# EasyEDA Pro project verysunshine-34e06a1e8bfa4ca7a126286b764d3f7b-42c390bd.epro

# Schematic 主机板SCH
Create Date: 2022-11-16; Page Name: Sheet_1; Project Name: 星火计划|分布式设备的物联网控制系统设计; Schematic Name: 主机板SCH; Update Date: 2022-11-18; Company: 嘉立创EDA; Page Size: A3; Version: V1.0
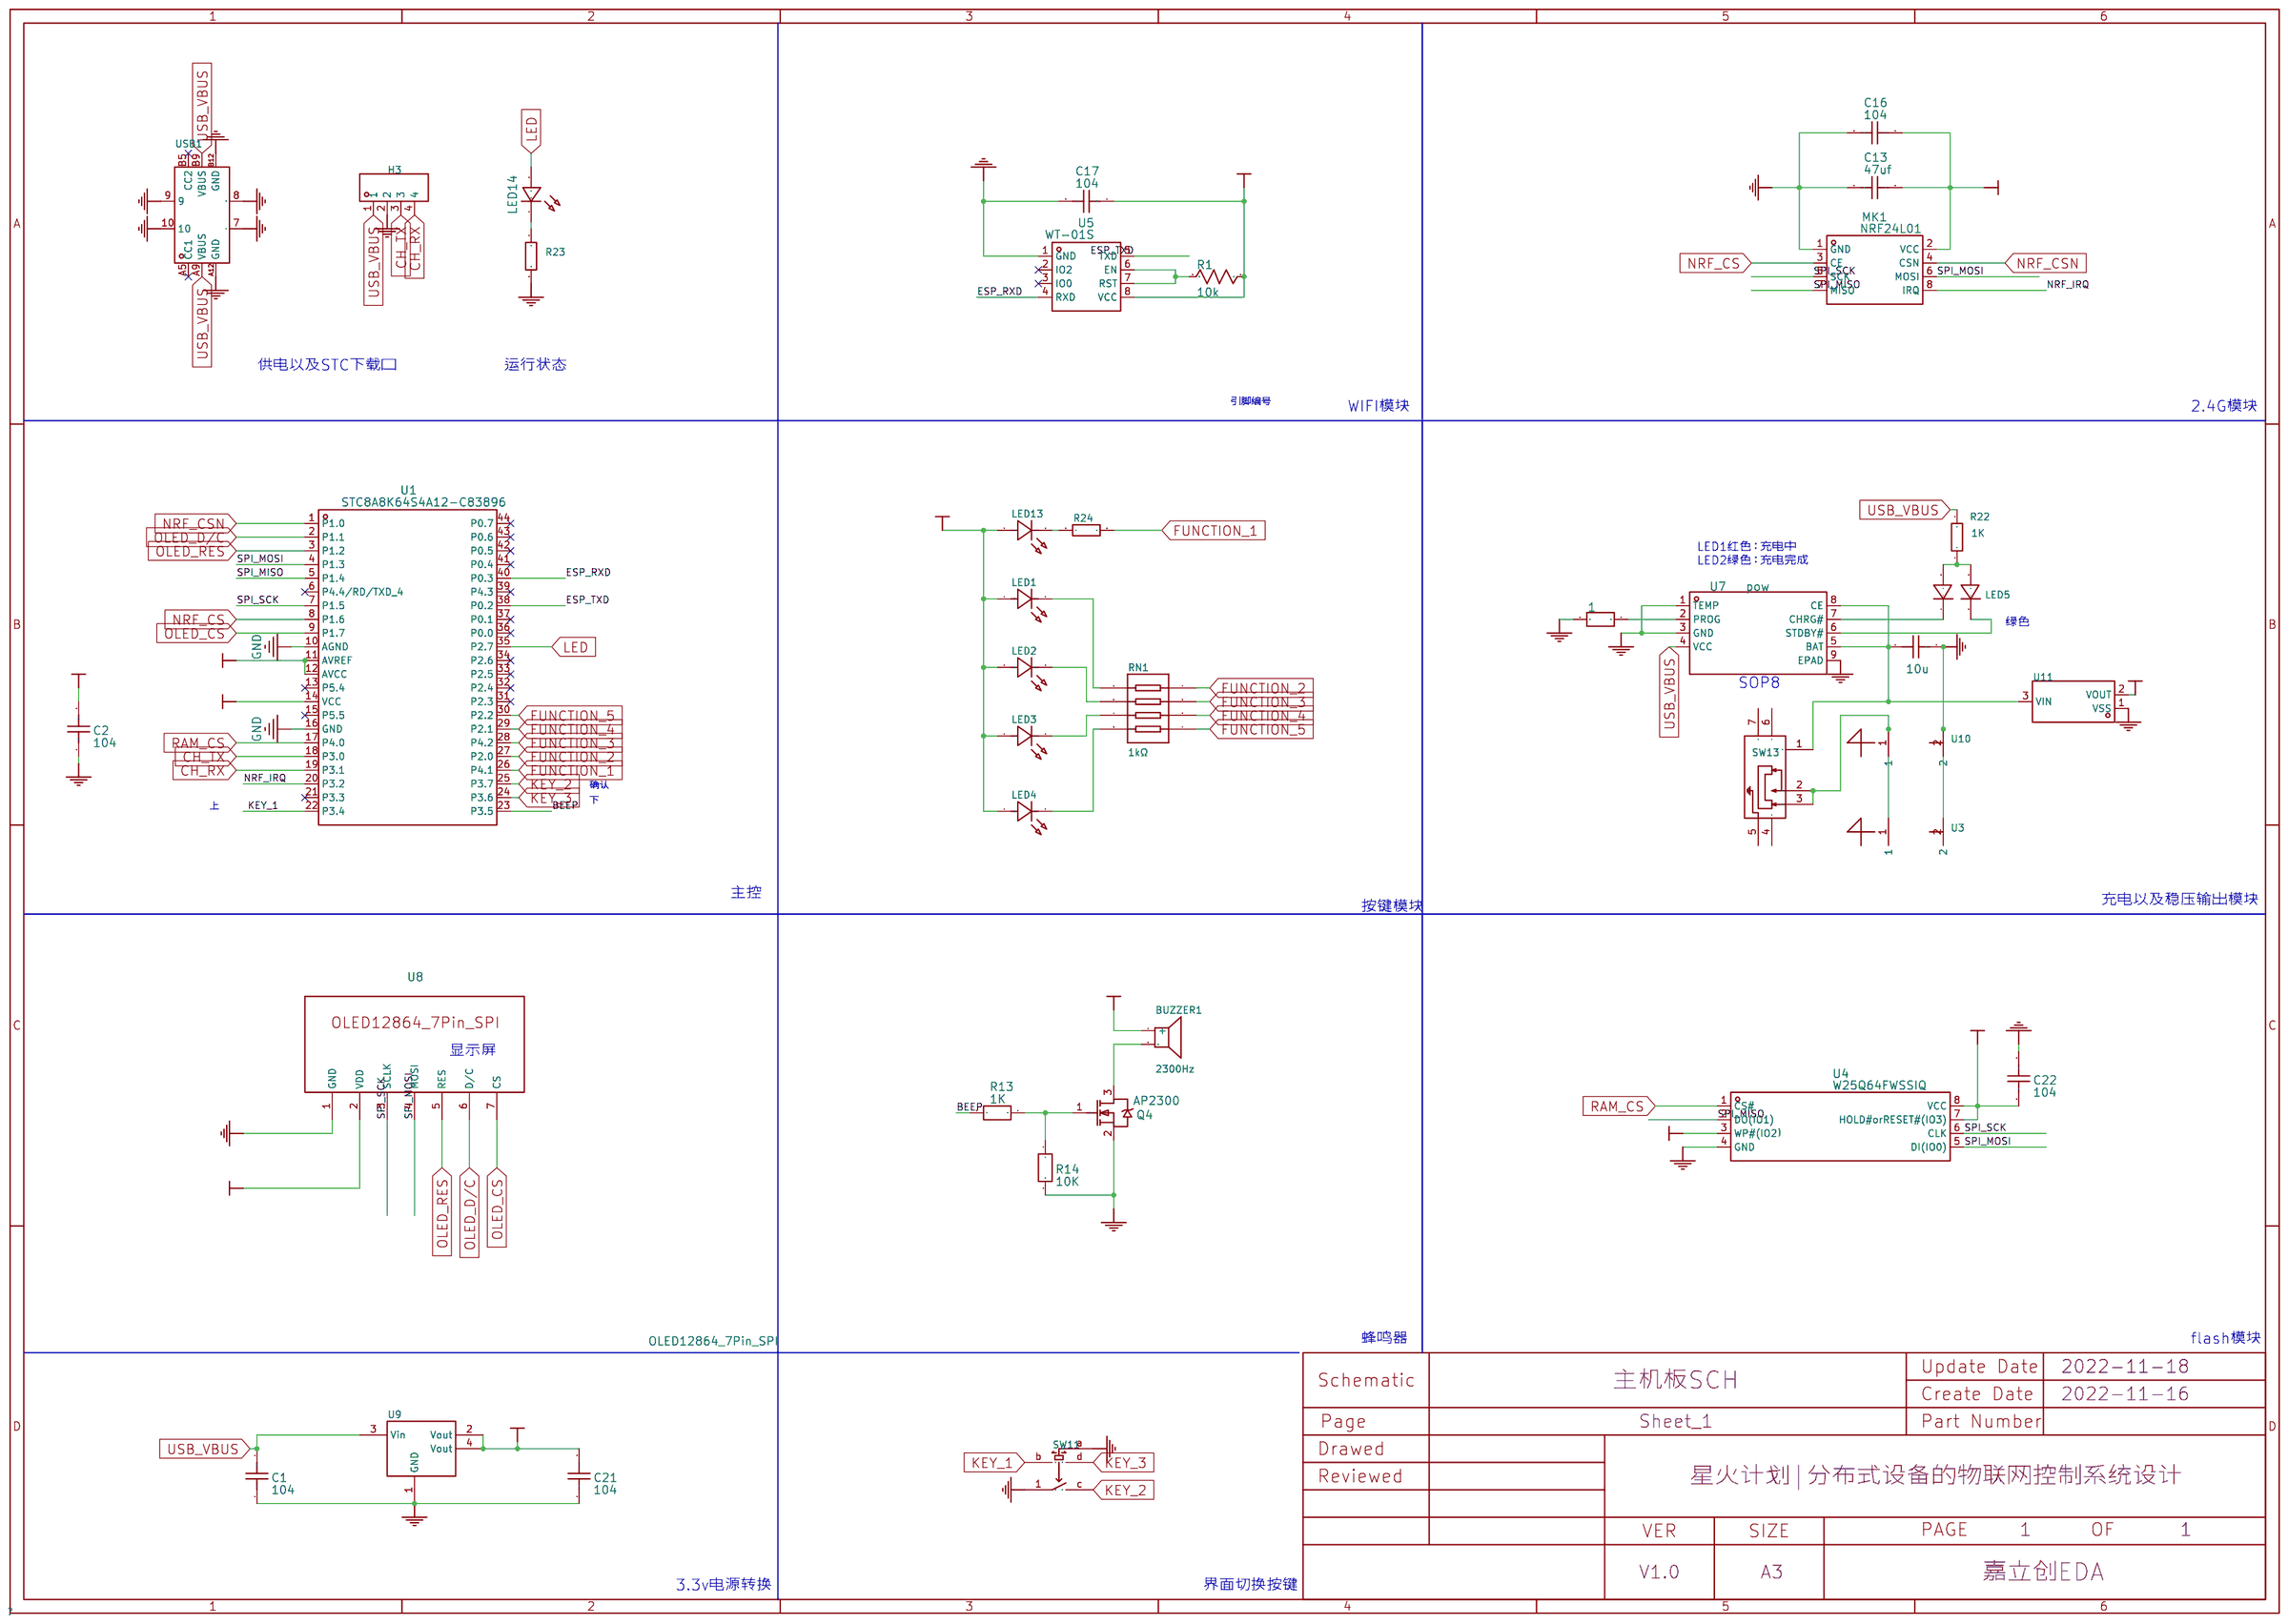
[diagram p0: schematic sheet]

## Parts
1  1k  [0805]
BUZZER1  2300Hz  [BUZ-TH_BD12.0-P7.60-D0.6-FD]
C1  104  [C0805]
C2  104  [C0805]
C9  10u  [C0805]
C13  47uf  [C0805]
C16  104  [C0805]
C17  104  [C0805]
C21  104  [C0805]
C22  104  [C0805]
H3  -  [HDR-TH_4P-P2.54-V-M]
LED1  MHS171UBCT  [LED-SMD_L2.1-W1.0-R-RD]
LED2  MHS171UBCT  [LED-SMD_L2.1-W1.0-R-RD]
LED3  MHS171UBCT  [LED-SMD_L2.1-W1.0-R-RD]
LED4  MHS171UBCT  [LED-SMD_L2.1-W1.0-R-RD]
LED5  E6C1209SEQBC2UDA  [LED-ARRAY-SMD_4P-L3.2-W2.7_E6C1209SEQBC2UDA]
LED13  MHS171UBCT  [LED-SMD_L2.1-W1.0-R-RD]
LED14  -  [LED0603-RD_BLUE]
MK1  NRF24L01  [WIRELM-NRF24L01]
Q4  AP2300  [SOT-23-3_L3.0-W1.7-P0.95-LS2.9-BR]
R1  10k  [R0805(2)]
R13  1K  [R0805(1)]
R14  10K  [R0805(1)]
R22  1K  [R0603]
R23  0603WAF1001T5E  [R0603]
R24  0603WAF1001T5E  [R0603]
RN1  1kΩ  [RES-ARRAY-SMD_0603-8P-L3.2-W1.6-BL]
SW11  TM-2022-3  [SW-SMD_TM-2022-3]
SW13  MSK12CO2-SZ  [SW-TH_MSK12C02]
U1  STC8A8K64S4A12-C83896  [LQFP-44_L10.0-W10.0-P0.80-LS12.0-BL]
U3  -  [电池座]
U4  W25Q64FWSSIQ  [SOIC-8_L5.3-W5.3-P1.27-LS8.0-BL]
U5  WT-01S  [WT-01S]
U7  pow  [SOP-8_L4.9-W3.9-P1.27-LS6.0-BL-EP]
U8  OLED12864_7Pin_SPI  [OLED-12864(7PIN-SPI)]
U9  BL1117-33CX  [SOT-223-4_L6.5-W3.5-P2.30-LS7.0-BR]
U10  -  [电池座]
U11  662K.  [SOT-23-3_L2.9-W1.3-P1.90-LS2.4-BR]
USB1  TYC-249D  [USB-C-SMD_TYC-249D]

## Library data of the parts
1 = 1k
BUZZER1 = TMB12A05: 驱动方式:有源(内含驱动线路);构造类型:电磁式;额定电压:5V;工作电压:4V~8V;频率:2300Hz;声压(SPL):85dB@5V,10cm;直径(D):12mm;高度:9.8mm;; Supplier Part: C96093; Manufacturer: 华能; Supplier Footprint: 插件,P=7.6mm; JLCPCB Part Class: Extended Part; Datasheet: https://atta.szlcsc.com/upload/public/pdf/source/20170522/1495448324811.pdf; Supplier: LCSC; Oscillator Circuit: 有源(内含驱动线路); Technology Type: 电磁式; Rated Voltage: 5V; Operating Voltage: 4V~8V; Sound Pressure Level (SPL): 85dB@5V,10cm; Diameter (φD): 12mm; Height: 9.8mm
C1 C2 C16 C17 C21 = 104_C0805
C9 = 10u
C13 = 47uf
C22 = 104_C0805(1)
H3 = HDR-M_2.54_1x4P: Supplier Part: C492403; Supplier Footprint: 插件
LED1-LED4 LED13 = MHS171UBCT: 发光颜色:蓝灯;二极管配置:-;透镜颜色:无色透明;主波长:467nm~476nm;峰值波长:468nm;色温:-;光通量(25时):-;测试电流:5mA;正向电压(VF):3.1V;发光强度:90mcd;功率:75mW;发光角度:140°;安装方式:侧贴;工作温度:-40~+85;; LCSC Part Name: 0805侧贴蓝色光; Supplier Part: C693906; Manufacturer: MEIHUA(美华); Supplier Footprint: 0805; JLCPCB Part Class: Extended Part; Datasheet: https://atta.szlcsc.com/upload/public/pdf/source/20200629/C693906_2892460FD04527E9A85093334938F5D1.pdf; Supplier: LCSC; Emitted Color: 蓝灯; Lens Color: 无色透明; Dominant Wavelength: 467nm~476nm; Peak Wavelength: 468nm; Forward Current: 5mA; Forward Voltage (VF): 3.1V; Luminous Intensity: 90mcd; Power Dissipation: 75mW; Viewing Angle: 140°; Mounting Sytle: 侧贴; Operating Temperature: -40~+85
LED5 = E6C1209SEQBC2UDA: 发光颜色:橙灯,蓝灯;; LCSC Part Name: 橙灯,蓝灯; Supplier Part: C389101; Manufacturer: ekinglux(亿晶源); Supplier Footprint: SMD,3.2x2.7x1.1mm; JLCPCB Part Class: Extended Part; Datasheet: https://atta.szlcsc.com/upload/public/pdf/source/20220330/7B8936B71A78AA2570A1C3103B939817.pdf; Supplier: LCSC; Emitted Color: 橙灯,蓝灯
LED14 = LED_0603-R: 发光颜色:红灯;二极管配置:-;透镜颜色:无色透明;主波长:617.5nm;峰值波长:632nm;色温:-;光通量(25时):-;测试电流:5mA;正向电压(VF):2.2V;发光强度:28.5mcd;功率:60mW;发光角度:120°;安装方式:-;工作温度:-40~+85;; Supplier Footprint: 0603; Supplier Part: C72044
MK1 = NRF24L01: Supplier: LCSC; Manufacturer: Ai-Thinker; Manufacturer Part: NRF24L01+功率加强版绑定2.4Gwireless module; Supplier Part: C90751
Q4 = AP2300: Supplier: LCSC; Supplier Part: C360338; Manufacturer: ShenZhen Quan Li Semiconductor
R1 = 10K_R0805: Supplier: LCSC; Manufacturer: RALEC; Manufacturer Part: RTT051002FTP; Supplier Part: C103904; JLCPCB Part Class: Extended Part
R13 = 1K_R0805
R14 = 10K_R0805(1)_1
R22 = Res_0603: Supplier Footprint: 0603
R23 R24 = 0603WAF1001T5E: LCSC Part Name: 1KΩ(1001) ±1% 编带; Supplier Part: C21190; Manufacturer: UNI-ROYAL(厚声); Supplier Footprint: 0603; JLCPCB Part Class: Basic Part; Datasheet: https://atta.szlcsc.com/upload/public/pdf/source/20170920/C21190_1505887441885980538.pdf; Supplier: LCSC
RN1 = EXB38V102JV: 阻值:1kΩ;单个元件功率:63mW;电阻器数:4;引脚数:8;; LCSC Part Name: 1kΩ ±5%; Supplier Part: C192512; Manufacturer: PANASONIC(松下); Supplier Footprint: 1206; JLCPCB Part Class: Extended Part; Datasheet: https://atta.szlcsc.com/upload/public/pdf/source/20180511/C192512_56D870360DEB9F31BF07F5772A6396FE.pdf; Supplier: LCSC; Power(Watts): 63mW; Number of Resistors: 4; Number of Pins: 8
SW11 = TM-2022-3: 数码相机拨轮开关  3挡拨轮开关; LCSC Part Name: 数码相机拨轮开关  3挡拨轮开关; Supplier Part: C318952; Manufacturer: XKB Connectivity(中国星坤); Supplier Footprint: SMD; JLCPCB Part Class: Extended Part; Datasheet: https://atta.szlcsc.com/upload/public/pdf/source/20211015/3476D939D9FB2BD124C91E3A6F460D4F.pdf; Supplier: LCSC
SW13 = MSK12CO2-SZ: 额定电流(DC)：50mA 额定电压(DC)：12V 电路结构：单刀双掷 安装方式：卧贴 机械寿命：10000 滑钮形状：矩形柱状 引脚样式：SMD接片 工作温度：-20~+70 开关长度：8mm 开关宽度：2.8mm 开关高度：1.4mm 柄高：1.5mm; LCSC Part Name: 迷你贴片拨动/两档侧拨 7脚 白柄，柄长1.5mm,耐温，高品质带金属丝; Supplier Part: C2681568; Manufacturer: SHOU HAN(首韩); Supplier Footprint: SMD; JLCPCB Part Class: Extended Part; Datasheet: https://atta.szlcsc.com/upload/public/pdf/source/20190925/C431540_89155AEF0758B9AD1B2D805F83FB12E3.pdf; Supplier: LCSC
U1 = STC8A8K64S4A12-C83896: Supplier: LCSC; Supplier Part: C83896; Manufacturer: STC Micro; Manufacturer Part: STC8A8K64S4A12; JLCPCB Part Class: Extended Part
U3 U10 = 电池焊点: Pin Type: IN
U4 = W25Q64FWSSIQ: Supplier: LCSC; Supplier Part: C783717; Manufacturer: Winbond Elec
U5 = WT-01S: Supplier: LCSC; Supplier Part: C477825; Manufacturer: Wireless-tag
U7 = TP4056X: Supplier: LCSC; Supplier Part: C191323; Manufacturer: Nanjing Extension Microelectronics
U8 = OLED12864_7Pin_SPI: Supplier Part: undefined
U9 = BL1117-33CX: 输出类型:固定;输出极性:正;输出通道数:1;最大输入电压:12V;输出电压:3.3V;压差:1.5V@(1A);输出电流:1A;电源纹波抑制比(PRSS):60dB@(120Hz);; LCSC Part Name: Vin=12V Vout=3.3V 1A 60dB@(120Hz); Supplier Part: C5400; Manufacturer: BL(上海贝岭); Supplier Footprint: SOT-223; JLCPCB Part Class: Extended Part; Datasheet: https://atta.szlcsc.com/upload/public/pdf/source/20170919/C5400_1505787322580977107.pdf; Supplier: LCSC; Output Type: 固定; Output Polarity: 正; Number of Outputs: 1; Maximum Input Voltage: 12V; Output Voltage: 3.3V; Dropout Voltage: 1.5V@(1A); Output Current: 1A; Power Supply Rejection Ratio (PRSS): 60dB@(120Hz)
U11 = 662K.: 输出类型:-;; LCSC Part Name: 662K; Supplier Part: C841298; Manufacturer: FM富满; Supplier Footprint: SOT-23-3; JLCPCB Part Class: Extended Part; Datasheet: https://atta.szlcsc.com/upload/public/pdf/watermark/20200922/C841298_3E220732626B158CD6AC195AF78C7FB8.pdf; Supplier: LCSC
USB1 = TYC-249D: 连接器类型:Type-C;标准:USB 3.1;公母:母座;触点数量:6;端口数量:1;安装方式:卧贴;额定电流 - 电源:3A;工作温度范围:-25~+85;; LCSC Part Name: Type-C 母座 卧贴; Supplier Part: C381471; Manufacturer: XUNPU(讯普); Supplier Footprint: SMD; JLCPCB Part Class: Extended Part; Datasheet: https://atta.szlcsc.com/upload/public/pdf/source/20190320/C381471_01D227E08E92676C770F757F66E1FCE3.pdf; Supplier: LCSC; Connector Type: Type-C; Standard: USB 3.1; Gender: 母座; Number of Contacts: 6; Number of Ports: 1; Mounting Style: 卧贴; Current Rating - Power (Max): 3A; Operating Temperature Range: -25~+85

## Nets
+3.3V: BUZZER1.1(+) C2.2 C13.1 C16.1 C17.1 C21.2 C22.2 LED1.1(A) LED2.1(A) LED3.1(A) LED4.1(A) LED13.1(A) MK1.2(VCC) R1.1 U1.11(AVREF) U1.12(AVCC) U1.14(VCC) U4.3(WP#(IO2）) U4.7(HOLD#orRESET#(IO3)) U4.8(VCC) U5.8(VCC) U8.2(VDD) U9.2(Vout) U9.4(Vout) U11.2(VOUT)
GND: 1.1 C1.1 C2.1 C9.1 C13.2 C16.2 C17.2 C21.1 C22.1 H3.2 MK1.1(GND) Q4.2(S) R14.2 R23.2 SW11.1(a) SW11.a U1.10(AGND) U1.16(GND) U3.2 U4.4(GND) U5.1(GND) U7.1(TEMP) U7.3(GND) U7.9(EPAD) U8.1(GND) U9.1(GND) U10.2 U11.1(VSS) USB1.7 USB1.8 USB1.9 USB1.10 USB1.A12(GND) USB1.B12(GND)
BEEP: R13.2 U1.23(P3.5)
CH_RX: H3.4 U1.19(P3.1)
CH_TX: H3.3 U1.18(P3.0)
ESP_RXD: U1.40(P0.3) U5.4(RXD)
ESP_TXD: U1.38(P0.2) U5.5(TXD)
FUNCTION_1: R24.2 U1.26(P4.1)
FUNCTION_2: RN1.4 U1.27(P2.0)
FUNCTION_3: RN1.3 U1.28(P4.2)
FUNCTION_4: RN1.2 U1.29(P2.1)
FUNCTION_5: RN1.1 U1.30(P2.2)
KEY_1: SW11.b U1.22(P3.4)
KEY_2: SW11.c U1.25(P3.7)
KEY_3: SW11.d U1.24(P3.6)
LED: LED14.2(A) U1.35(P2.7)
NRF_CS: MK1.3(CE) U1.8(P1.6)
NRF_CSN: MK1.4(CSN) U1.1(P1.0)
NRF_IRQ: MK1.8(IRQ) U1.20(P3.2)
OLED_CS: U1.9(P1.7) U8.7(CS)
OLED_D/C: U1.2(P1.1) U8.6(D/C)
OLED_RES: U1.3(P1.2) U8.5(RES)
RAM_CS: U1.17(P4.0) U4.1(CS#)
SPI_MISO: MK1.7(MISO) U1.5(P1.4) U4.2(DO(IO1))
SPI_MOSI: MK1.6(MOSI) U1.4(P1.3) U4.5(DI(IO0)) U8.4(MOSI)
SPI_SCK: MK1.5(SCK) U1.7(P1.5) U4.6(CLK) U8.3(SCLK)
USB_VBUS: C1.2 H3.1 R22.2 U7.4(VCC) U9.3(Vin) USB1.A9(VBUS) USB1.B9(VBUS)
$1N559: BUZZER1.2 Q4.3(D)
$1N584: Q4.1(G) R13.1 R14.1
$1N669: LED13.2(K) R24.1
$1N709: LED14.1(C) R23.1
$1N821: R1.2 U5.6(EN) U5.7(RST)
$1N17643: LED1.2(K) RN1.5
$1N17699: LED2.2(K) RN1.6
$1N17755: LED3.2(K) RN1.7
$1N17811: LED4.2(K) RN1.8
$1N51830: 1.2 U7.2(PROG)
$1N51836: LED5.1(+) LED5.3(+) R22.1
$1N51837: LED5.4(-) U7.7(CHRG#)
$1N51838: LED5.2(-) U7.6(STDBY#)
$1N53808: C9.2 SW13.1 U7.5(BAT) U7.8(CE) U11.3(VIN)
$1N54478: SW13.2 SW13.3 U3.1 U10.1

Not connected (* = marked no-connect by the designer): SW13 4 5(4) 6(4) 7(4); U1 6(P4.4/RD/TXD_4)* 13(P5.4)* 15(P5.5)* 21(P3.3)* 31(P2.3)* 32(P2.4)* 33(P2.5)* 34(P2.6)* 36(P0.0)* 37(P0.1)* 39(P4.3)* 41(P0.4)* 42(P0.5)* 43(P0.6)* 44(P0.7)*; U5 2(IO2)* 3(IO0)*; USB1 A5(CC1)* B5(CC2)*

## Notes on the sheet
- 供电以及STC下载口
- 运行状态
- 引脚编号
- WIFI模块
- 2.4G模块
- LED1红色：充电中
- LED2绿色：充电完成
- 绿色
- SOP8
- 确认
- 下
- 上
- 主控
- 充电以及稳压输出模块
- 按键模块
- 显示屏
- 蜂鸣器
- flash模块
- 3.3v电源转换
- 界面切换按键

# Board 主机板PCB
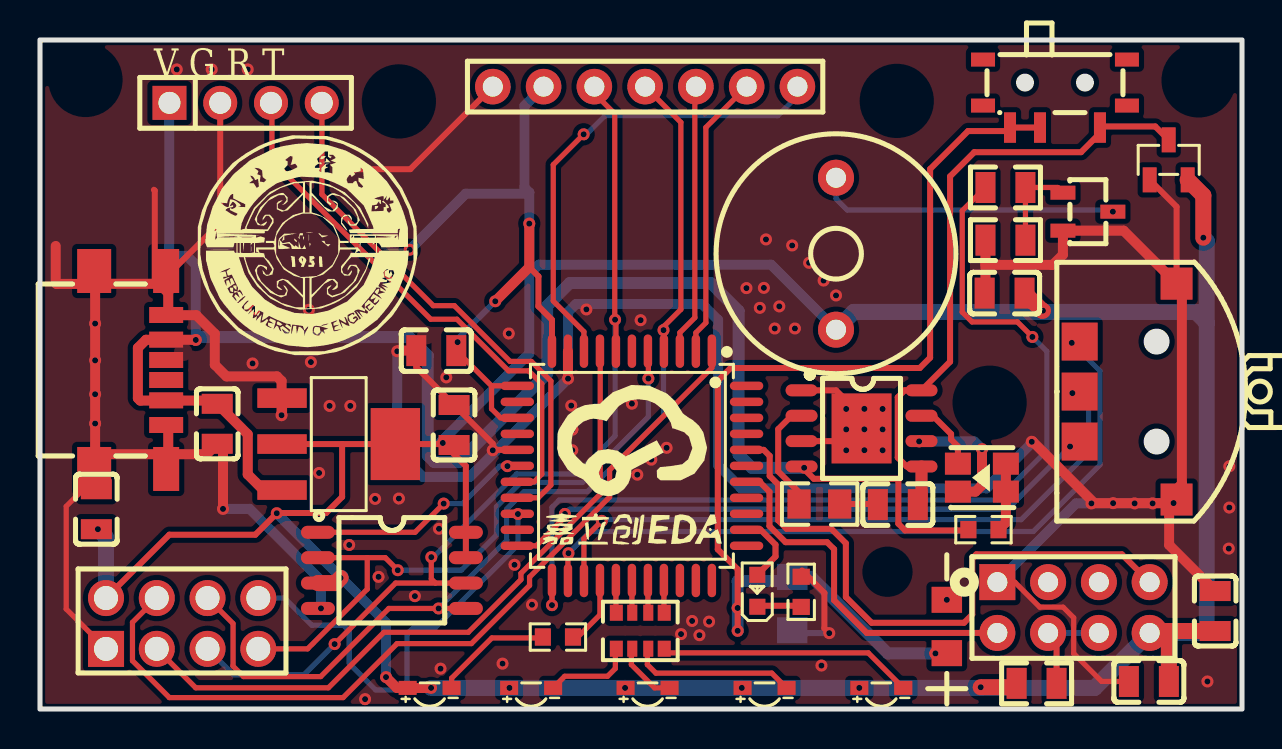
[diagram p1: board, top side]
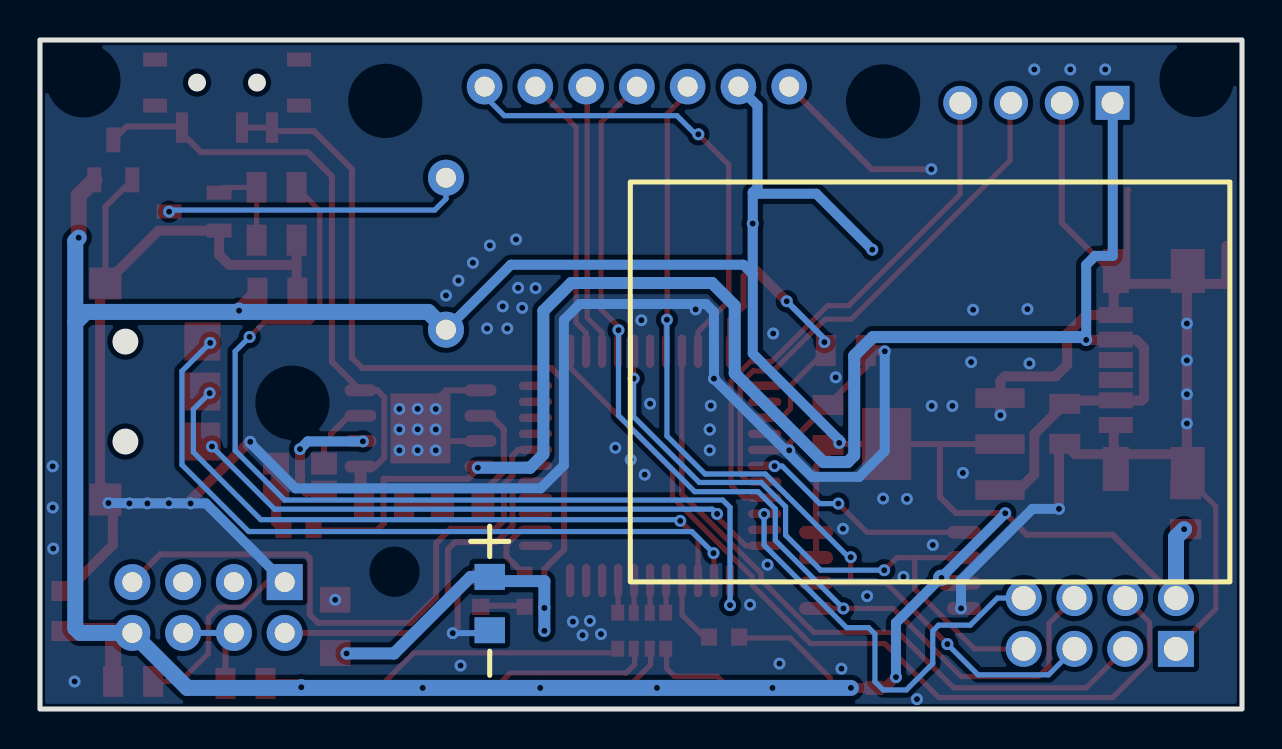
[diagram p2: board, bottom side, seen from below]

Outline 60.14 x 33.46 mm; copper layers: Top Layer, Bottom Layer. Coordinates in mm from the lower left corner of the outline.
Outline path: rectangle 0,33.46 60.14,0
Stack: Top Layer 0.035mm / 介电1 1.51mm FR4 er 4.5 / Bottom Layer 0.035mm

## Design rules (mm)
spacing Default (default): track to track 0.127, other pairs 0 to 0.102
spacing pow: track to track 0.127, other pairs 0 to 0.127
spacing Plane_Default: track to track 0.127, other pairs 0 to 0.102
spacing Plane_pow: track to track 0.127, other pairs 0 to 0.102
spacing Copper_gge284063: track to track 0.127, other pairs 0 to 0.102
track width Default (default): min 0.254, default 0.3, max 25.4
track width pow: min 0.3, default 0.5, max 25.4
track width 3.3: min 0.127, default 0.8, max 2.54
differential pair differentialPair (default): width min 0.127, default 0.35, max 2.54; gap min 0.152, default 0.152
net +3.3V uses 3.3, pow
pour e703 uses Copper_gge284063
pour e818 uses Copper_gge284063

## Placement (name value [footprint] x y rotation side)
1  1k  [0805]  39 10.25 180 top
BUZZER1  2300Hz  [BUZ-TH_BD12.0-P7.60-D0.6-FD]  39.83 22.77 90 top
C1  104  [C0805]  8.87 14.27 90 top
C2  104  [C0805]  19.83 17.93 0 top
C9  10u  [C0805]  42.92 10.23 0 top
C13  47uf  [C0805]  48.26 20.8 180 top
C16  104  [C0805]  2.82 9.99 90 top
C17  104  [C0805]  55.48 1.38 180 top
C21  104  [C0805]  20.72 14.21 270 top
C22  104  [C0805]  58.8 4.9 270 top
H3  -  [HDR-TH_4P-P2.54-V-M]  10.29 30.32 0 top
LED1  MHS171UBCT  [LED-SMD_L2.1-W1.0-R-RD]  24.57 1.06 180 top
LED2  MHS171UBCT  [LED-SMD_L2.1-W1.0-R-RD]  30.4 1.06 180 top
LED3  MHS171UBCT  [LED-SMD_L2.1-W1.0-R-RD]  36.25 1.06 180 top
LED4  MHS171UBCT  [LED-SMD_L2.1-W1.0-R-RD]  42.09 1.06 180 top
LED5  E6C1209SEQBC2UDA  [LED-ARRAY-SMD_4P-L3.2-W2.7_E6C1209SEQBC2UDA]  47.13 11.57 180 top
LED13  MHS171UBCT  [LED-SMD_L2.1-W1.0-R-RD]  19.49 1.06 180 top
LED14  -  [LED0603-RD_BLUE]  35.89 5.91 90 top
MK1  NRF24L01  [WIRELM-NRF24L01]  7.11 4.28 180 top
Q4  AP2300  [SOT-23-3_L3.0-W1.7-P0.95-LS2.9-BR]  52.43 24.88 180 top
R1  10k  [R0805(2)]  49.86 1.28 0 top
R13  1K  [R0805(1)]  48.3 26.09 180 top
R14  10K  [R0805(1)]  48.3 23.45 180 top
R22  1K  [R0603]  47.2 8.97 180 top
R23  0603WAF1001T5E  [R0603]  38.09 5.86 90 top
R24  0603WAF1001T5E  [R0603]  25.91 3.6 0 top
RN1  1kΩ  [RES-ARRAY-SMD_0603-8P-L3.2-W1.6-BL]  30.04 3.92 180 top
SW11  TM-2022-3  [SW-SMD_TM-2022-3]  54.44 15.88 270 top
SW13  MSK12CO2-SZ  [SW-TH_MSK12C02]  50.78 30.78 180 top
U1  STC8A8K64S4A12-C83896  [LQFP-44_L10.0-W10.0-P0.80-LS12.0-BL]  29.62 12.16 180 top
U3  -  [电池座]  45.37 4.06 90 bottom
U4  W25Q64FWSSIQ  [SOIC-8_L5.3-W5.3-P1.27-LS8.0-BL]  17.61 6.93 270 top
U5  -  [WT-01S]  51.71 5.08 90 top
U7  pow  [SOP-8_L4.9-W3.9-P1.27-LS6.0-BL-EP]  41.1 14.04 270 top
U8  OLED12864_7Pin_SPI  [OLED-12864(7PIN-SPI)]  30.28 31.13 0 top
U9  BL1117-33CX  [SOT-223-4_L6.5-W3.5-P2.30-LS7.0-BR]  14.95 13.25 180 top
U10  -  [电池座]  37.64 5.34 270 top
U11  662K.  [SOT-23-3_L2.9-W1.3-P1.90-LS2.4-BR]  56.47 27.47 270 top
USB1  TYC-249D  [USB-C-SMD_TYC-249D]  4.51 16.96 270 top

## Footprints (pads in the part's own frame, mm; a bottom-side part is the same pattern mirrored in y, then rotated)
0805
  rect 1.16x1.45 smd: 1(-1.016,0) 2(1.016,0)
BUZ-TH_BD12.0-P7.60-D0.6-FD
  round 1.801 hole 1.001: 1(-3.8,0) 2(3.8,0)
C0805
  rect 1x1.55 smd: 1(-1,0) 2(1,0)
HDR-TH_4P-P2.54-V-M
  rect 1.7x1.7 hole 1.1: 1(-3.81,0)
  round 1.7 hole 1.1: 2(-1.27,0) 3(1.27,0) 4(3.81,0)
LED0603-RD_BLUE
  rect 0.8x0.8 smd: 1(-0.8,-0.003) 2(0.8,0.003)
LED-ARRAY-SMD_4P-L3.2-W2.7_E6C1209SEQBC2UDA
  rect 1.3x1.1 smd: 1(-1.2,0.7) 2(1.2,0.7) 3(-1.2,-0.7) 4(1.2,-0.7)
LED-SMD_L2.1-W1.0-R-RD
  rect 0.9x0.7 smd: 1(1.1,0) 2(-1.1,0)
LQFP-44_L10.0-W10.0-P0.80-LS12.0-BL
  oval 0.42x1.67 smd: 1(-4,-5.735) 2(-3.2,-5.735) 3(-2.4,-5.735) 4(-1.6,-5.735) 5(-0.8,-5.735) 6(0,-5.735) 7(0.8,-5.735) 8(1.6,-5.735) 9(2.4,-5.735) 10(3.2,-5.735) 11(4,-5.735) 23(4,5.735) 24(3.2,5.735) 25(2.4,5.735) 26(1.6,5.735) 27(0.8,5.735) 28(0,5.735) 29(-0.8,5.735) 30(-1.6,5.735) 31(-2.4,5.735) 32(-3.2,5.735) 33(-4,5.735)
  oval 1.67x0.42 smd: 12(5.735,-4) 13(5.735,-3.2) 14(5.735,-2.4) 15(5.735,-1.6) 16(5.735,-0.8) 17(5.735,0) 18(5.735,0.8) 19(5.735,1.6) 20(5.735,2.4) 21(5.735,3.2) 22(5.735,4) 34(-5.735,4) 35(-5.735,3.2) 36(-5.735,2.4) 37(-5.735,1.6) 38(-5.735,0.8) 39(-5.735,0) 40(-5.735,-0.8) 41(-5.735,-1.6) 42(-5.735,-2.4) 43(-5.735,-3.2) 44(-5.735,-4)
OLED-12864(7PIN-SPI)
  round 1.778 hole 1.001: 1(-7.62,0) 2(-5.08,0) 3(-2.54,0) 4(0,0) 5(2.54,0) 6(5.08,0) 7(7.62,0)
R0603
  rect 0.806x0.864 smd: 1(-0.753,0) 2(0.753,0)
R0805(1)
  rect 1x1.55 smd: 1(-1,0) 2(1,0)
R0805(2)
  rect 1x1.55 smd: 1(-1,0) 2(1,0)
RES-ARRAY-SMD_0603-8P-L3.2-W1.6-BL
  rect 0.65x0.8 smd: 1(-1.199,-0.899) 4(1.199,-0.899) 5(1.199,0.899) 8(-1.199,0.899)
  rect 0.5x0.8 smd: 2(-0.399,-0.899) 3(0.402,-0.899) 6(0.402,0.899) 7(-0.399,0.899)
SOIC-8_L5.3-W5.3-P1.27-LS8.0-BL
  oval 0.65x1.7 smd: 1(-1.905,-3.7) 2(-0.635,-3.7) 3(0.635,-3.7) 4(1.905,-3.7) 5(1.905,3.7) 6(0.635,3.7) 7(-0.635,3.7) 8(-1.905,3.7)
SOP-8_L4.9-W3.9-P1.27-LS6.0-BL-EP
  oval 0.6x1.6 smd: 1(-1.905,-3) 2(-0.635,-3) 3(0.635,-3) 4(1.905,-3) 5(1.905,3) 6(0.635,3) 7(-0.635,3) 8(-1.905,3)
  rect 3.5x3 smd: 9(0,0)
SOT-23-3_L2.9-W1.3-P1.90-LS2.4-BR
  rect 1.25x0.7 smd: 1(1,-0.95) 2(1,0.95) 3(-1,0)
SOT-23-3_L3.0-W1.7-P0.95-LS2.9-BR
  rect 1.25x0.7 smd: 1(1.25,-0.95) 2(1.25,0.95) 3(-1.25,0)
SOT-223-4_L6.5-W3.5-P2.30-LS7.0-BR
  rect 2.47x0.98 smd: 1(2.835,-2.3) 2(2.835,0) 3(2.835,2.3)
  rect 2.47x3.6 smd: 4(-2.835,0)
SW-SMD_TM-2022-3
  rect 1.6x1.6 smd: a(-5.4,2.425) a(5.4,2.425)
  rect 1.9x1.8 smd: b(2.5,-2.425) c(0,-2.425) d(-2.5,-2.425)
SW-TH_MSK12C02
  rect 0.6x1.524 smd: 1(-2.25,1.7) 2(0.75,1.7) 3(2.25,1.7)
  rect 1.2x0.7 smd: 4(-3.6,0.6) 4(-3.6,-1.7) 4(3.6,0.6) 4(3.6,-1.7)
USB-C-SMD_TYC-249D
  rect 2.2x1.3 smd: 7(-4.95,1.801) 10(4.95,1.801)
  rect 2.2x1.7 smd: 8(-4.95,-1.801) 9(4.95,-1.801)
  rect 0.8x1.7 smd: A5(-0.5,1.801) A9(1.519,1.801) A12(2.751,1.801) B5(0.5,1.801) B9(-1.519,1.801) B12(-2.751,1.801)
WIRELM-NRF24L01
  rect 1.8x1.8 hole 1.2: 1(3.808,1.272)
  round 1.8 hole 1.2: 2(3.81,-1.272) 3(1.27,1.268) 4(1.27,-1.272) 5(-1.27,1.268) 6(-1.27,-1.272) 7(-3.81,1.268) 8(-3.81,-1.272)
WT-01S
  rect 1.8x1.8 hole 1: 1(1.27,3.81)
  round 1.8 hole 1: 2(1.27,1.27) 3(1.27,-1.27) 4(1.27,-3.81) 5(-1.27,3.81) 6(-1.27,1.27) 7(-1.27,-1.27) 8(-1.27,-3.81)
电池座
  rect 1.3x1.524 smd far side: 1(-1.27,0) 2(1.397,0)

## Nets
As in the schematic, except:
GND: 1.1 C1.1 C2.1 C9.1 C13.2 C16.2 C17.2 C21.1 C22.1 H3.2 MK1.1 Q4.2 R14.2 R23.2 SW11.a U1.10 U1.16 U3.2 U4.4 U5.1 U7.1 U7.3 U7.9 U8.1 U9.1 U10.2 U11.1 USB1.7 USB1.8 USB1.9 USB1.10 USB1.A12 USB1.B12

Pads without a net: SW13 4; U1 6 13 15 21 31 32 33 34 36 37 39 41 42 43 44; U5 2 3; USB1 A5 B5

## Via types
v1: diameter 0.6, hole 0.305, Top Layer to Bottom Layer, 125 vias

## Routing (per net, layer and track width the routed paths; a pad name or vN(x,y) marks a point on that pad's centre or on a via; arc(x,y) is an arc through that point)
+3.3V: length 203.1
  Top Layer w0.26: 23.88,14.56 23.05,14.56 22.59,15.02 22.59,16.16 ; U1.12 22.59,16.16 ; 22.59,16.16 C2.2
  Top Layer w0.3: U1.11 25.62,19.47 24.94,20.14 24.94,21.64 24.48,22.1 ; MK1.2 6.47,8.72 10.77,8.72 v1(11.85,9.79) 11.86,9.81 14.31,9.81 15.12,10.61 15.12,13.25 12.11,13.25 ; C2.2 20.83,18.29 v1(20.89,18.35) ; 15.14,13.25 U9.4 20.1,13.25 v1(20.15,13.31) 21.31,12.15 U4.8 U4.7
  Top Layer w0.5: v1(24.48,24.28) 24.48,22.1 v1(22.78,20.39) ; v1(19.57,1.06) 19.56,1.05 18.4,1.05 LED13.1 17.85,1.06 v1(17.31,1.6)
  Top Layer w0.8: v1(47.07,1.09) 48.66,1.09 48.91,1.34 ; v1(15.04,6.56) 14.78,6.3 U4.3 ; v1(58.2,23.57) 58.2,25.68 U11.2 ; C13.1 50.14,19.92 v1(50.18,19.92) ; 56.4,3.9 56.48,3.82 C17.1 ; 56.4,3.9 C22.2 ; 56.4,3.9 55.61,3.9 U5.8 ; v1(2.9,8.99) C16.1
  Bottom Layer w0.3: v1(20.89,18.35) 20.89,18.51 v1(22.78,20.39)
  Bottom Layer w0.5: v1(20.15,13.31) 20.08,13.38 24.48,17.78 24.48,21.75 ; v1(18.5,22.97) 21.3,25.77 24.42,25.77 24.48,25.84 ; 24.48,21.75 v1(24.48,24.28) 24.48,25.84 ; 24.48,21.75 24.95,22.22 36.58,22.22 39.83,18.97 ; 24.48,25.84 24.24,26.08 24.24,30.17 U8.2 ; v1(11.85,9.79) 11.85,9.78 15.05,6.57 17.31,4.31 v1(17.31,1.6)
  Bottom Layer w0.8: 58.38,19.32 58.38,4.05 58.13,3.81 U5.8 52.77,1.06 47.07,1.06 ; 58.38,19.32 57.83,19.86 50.18,19.86 ; 58.38,19.32 58.38,23.4 v1(58.2,23.57) ; v1(19.57,1.06) v1(23.49,1.06) v1(29.27,1.06) v1(35.11,1.06) v1(40.99,1.06) 47.07,1.06 ; v1(15.04,6.56) 15.05,6.57 ; 50.18,19.86 40.72,19.86 39.83,18.97 ; 50.18,19.86 v1(50.18,19.92) ; v1(2.9,8.99) 3.3,8.59 MK1.2 ; 47.07,1.06 v1(47.07,1.09)
GND: length 226.3
  Top Layer w0.26: U5.1 48.77,6.35 50.02,5.09 51.19,5.09 51.72,4.57 51.72,2.78 53.12,1.38 C17.2 ; 56.63,10.48 56.49,10.62 ; 50.6,22.22 50.64,22.18 ; MK1.1 1.31,5 1.31,10.14 2.17,10.99 C16.2
  Top Layer w0.3: 1.1 41.89,10.25 C9.1 ; U11.1 56.87,25.12 SW11.a ; v1(39.49,3.79) 39.24,4.04 39.24,5.81 38.13,6.93 ; 40.34,14.98 40.34,15.43 39.83,15.94 U7.1 ; 40.34,14.98 40.34,14.02 40.48,14.02 ; 40.34,14.98 40.52,14.81 40.52,14.05 40.48,14.02 ; 40.34,14.98 40.33,15 ; 40.48,14.02 39.87,13.4 U7.3 ; U8.1 18.53,27 v1(15.54,27) ; U1.16 22.68,12.96 v1(22.65,12.94) 22.65,13.27 C21.1 18.83,17.09 C2.1 ; H3.2 9.02,24.32 5.96,21.27 5.74,21.49 5.74,25.93 5.7,25.97
  Top Layer w0.5: U1.10 26.42,16.53 v1(26.42,16.52) ; C16.2 2.76,11.06 2.76,12.75 ; 12.11,15.55 12.11,14.72 v1(12.09,14.69) 12.09,16.41 11.86,16.64 9.33,16.64 8.75,17.22 8.75,18.77 7.82,19.7 6.42,19.7 6.42,20.81 5.96,21.27 2.76,21.27 ; 47.3,22.22 50.67,22.22 51.18,22.72 Q4.2 54.22,23.93 SW11.a 57.13,21.01 57.13,11.25 56.49,10.62 ; 47.3,22.22 R14.2 ; 47.3,22.22 47.3,20.84 C13.2 ; 6.6,12.75 2.76,12.75 ; 6.6,12.75 6.42,12.93 6.42,14.2 ; 6.6,12.75 8.35,12.75 C1.1 9.16,12.98 v1(9.16,10.01) ; 2.76,12.75 v1(2.76,14.28) v1(2.76,15.74) v1(2.76,17.44) v1(2.76,19.28) 2.76,21.27 ; 2.76,21.27 2.76,21.39 2.63,21.26 0.83,21.26 0.79,21.3 0.79,23.16 ; 2.76,21.27 2.64,21.27 ; 56.49,10.3 v1(53.69,10.3) 52.75,10.3 49.68,13.37 v1(49.62,13.37) ; 56.49,10.3 56.71,10.3 v1(56.72,10.3) ; 56.49,10.3 56.49,8.21 C22.1 ; 56.49,10.3 56.68,10.48 SW11.a ; v1(14.06,5.03) 14.05,5.03 U4.4 ; C2.1 17.91,17.93 v1(17.87,17.89)
  Bottom Layer w0.3: v1(39.49,3.79) 37.78,3.79 U10.2 ; v1(22.65,12.94) 22.75,12.85
  Bottom Layer w0.5: v1(17.87,17.89) 17.87,12.9 19.16,11.61 21.51,11.61 v1(26.42,16.52) 26.42,19.86 26.82,20.26 33.13,20.26 33.93,19.46 33.93,12.19 35.08,11.04 47.35,11.04 49.62,13.3 v1(49.62,13.37) ; v1(14.06,5.03) 14.06,6.44 10.49,10.01 v1(9.16,10.01) ; v1(56.72,10.3) 55.68,10.3 v1(55.67,10.28) v1(54.77,10.28) v1(52.61,10.28) 51.84,10.28 U5.1
  vias: v1(6.84,31.99) v1(8.59,31.99) v1(10.39,31.99) v1(10.64,17.28) v1(10.74,20) v1(13.45,19.97) v1(13.55,17.35) v1(13.97,11.81) v1(14.49,15.16) v1(15.53,15.16) v1(15.47,8.21) v1(16.26,0.49) v1(16.77,10.51) v1(16.94,6.61) v1(17.96,10.53) v1(18.76,5.65) v1(19.96,9.01) v1(20.04,2.02) v1(20.33,16.59) v1(23.14,2.27) v1(23.46,18.78) v1(23.74,7.21) v1(24.62,5.22) v1(26.58,15.18) v1(26.63,13.98) v1(26.63,13.98) v1(26.63,12.94) v1(27.34,19.99) v1(29.62,15.27) v1(29.89,11.72) v1(30.05,19.45) v1(30.58,12.47) v1(31.35,13.06) v1(32.07,3.75) v1(32.63,4.4) v1(32.99,3.69) v1(33.48,4.37) v1(35.35,21.05) v1(36.02,20.07) v1(36.22,21.06) v1(36.32,23.49) v1(36.76,19.03) v1(36.99,20.14) v1(37.63,23.19) v1(37.77,19.03) v1(38.48,22.32) v1(39.1,2.17) v1(39.21,21.43) v1(39.83,20.68) v1(40.34,15.01) v1(40.34,13.98) v1(40.34,12.94) v1(41.25,15.01) v1(41.25,13.99) v1(41.25,12.95) v1(42.16,15.01) v1(42.16,13.98) v1(42.16,12.94) v1(45.37,5.46) v1(58.41,1.38) v1(59.51,12.14) v1(59.51,10.08) v1(59.48,8.02)
BEEP: length 48.8
  Top Layer w0.26: v1(49.65,18.61) 48.9,19.36 46.64,19.36 46.14,19.85 46.14,24.92 R13.2 ; U1.23 v1(25.62,5.2) 25.61,5.19
  Bottom Layer w0.26: v1(25.62,5.2) 25.62,10.09 25.98,10.45 47.9,10.45 50.38,12.93 50.38,17.89 v1(49.65,18.61)
CH_RX: length 27.1
  Top Layer w0.26: 23.88,10.56 24.93,10.56 25.56,11.2 25.56,16.41 24.58,17.39 23.52,17.39 20.73,20.17 19.68,20.17 14.11,25.74 14.11,30.31 H3.4
CH_TX: length 26.9
  Top Layer w0.26: U1.18 24.72,11.36 25.1,11.75 25.1,16.26 24.45,16.91 23.44,16.91 20.86,19.5 19.55,19.5 11.61,27.44 11.61,30.27 H3.3
ESP_RXD: length 30.6
  Top Layer w0.3: U5.4 54.13,7.74 46.85,7.74 46.64,7.53 46.64,4.72 46.23,4.31 41.61,4.31 40.32,5.6 40.32,8.29 39.59,9.01 37.36,9.01 36.94,9.44 36.94,11.23 36.51,11.65 36.51,12.66 36.2,12.96 U1.40
ESP_TXD: length 18.2
  Top Layer w0.3: U1.38 36,11.36 36.5,10.86 36.5,9.15 37.3,8.34 39.38,8.34 39.73,7.99 39.73,5.44 41.37,3.81 U5.5
FUNCTION_1: length 3.4
  Top Layer w0.26: U1.26 28.02,4.71 26.86,3.55
FUNCTION_2: length 1.8
  Top Layer w0.26: 28.79,4.61 28.82,4.64 U1.27
FUNCTION_3: length 1.8
  Top Layer w0.26: U1.28 29.62,4.64 29.59,4.61
FUNCTION_4: length 1.8
  Top Layer w0.26: 30.39,4.61 30.42,4.64 U1.29
FUNCTION_5: length 1.8
  Top Layer w0.26: 31.19,4.61 31.22,4.64 U1.30
KEY_1: length 30.4
  Top Layer w0.26: v1(26.26,9.76) 26.26,9.6 24.83,8.16 U1.22 ; SW11.b 51.79,13.38 v1(51.54,13.13)
  Bottom Layer w0.26: v1(51.54,13.13) 48.4,9.99 26.5,9.99 v1(26.26,9.76)
KEY_2: length 32.8
  Top Layer w0.26: SW11.c 51.73,15.88 v1(51.65,15.8) ; v1(28.11,9.41) 27.22,8.52 U1.25
  Bottom Layer w0.26: v1(51.65,15.8) 52.47,14.99 52.47,12.85 49.09,9.47 28.17,9.47 v1(28.11,9.41)
KEY_3: length 36.9
  Top Layer w0.26: v1(26.44,7.79) 26.42,7.77 U1.24 ; v1(51.62,18.31) 51.95,18.31 SW11.d
  Bottom Layer w0.26: v1(51.62,18.31) 53.04,16.9 53.04,12.21 49.7,8.88 27.53,8.88 v1(26.44,7.79)
LED: length 3.6
  Top Layer w0.3: U1.35 36.05,8.96 36.8,8.22 36.8,7.63 LED14.2
NRF_CS: length 34.3
  Top Layer w0.26: U1.8 28.03,17.88 28.03,10.75 24.06,6.79 24.06,6.47 21.43,3.84 17.21,3.84 14.43,1.06 7.79,1.06 MK1.3
NRF_CSN: length 42.1
  Top Layer w0.26: MK1.4 4.63,4.33 4.63,2.42 6.47,0.57 15.17,0.57 17.87,3.27 21.58,3.27 24.49,6.18 24.49,6.6 28.5,10.6 28.5,11.95 33.62,17.07 U1.1
NRF_IRQ: length 21.8
  Top Layer w0.26: v1(23.91,9.75) 23.9,9.76 U1.20
  Bottom Layer w0.26: v1(23.91,9.75) 23.91,8.19 19.79,4.07 18.68,4.07 18.37,3.75 18.37,1.37 17.95,0.95 16.79,0.95 15.47,2.28 15.47,3.9 15.18,4.19 13.6,4.19 12.24,5.55 MK1.8
OLED_CS: length 24.1
  Top Layer w0.26: 27.21,17.9 27.21,18.87 25.68,20.41 25.68,27.22 v1(27.2,28.74)
  Bottom Layer w0.26: U8.7 37.9,30.66 36.92,29.68 28.27,29.68 27.34,28.74 v1(27.2,28.74)
OLED_D/C: length 14.3
  Top Layer w0.26: 35.36,31.13 33.32,29.09 33.32,19.32 32.82,18.82 U1.2
OLED_RES: length 13.6
  Top Layer w0.26: U1.3 32.02,18.83 32.76,19.58 32.76,31.08 U8.5
RAM_CS: length 11.3
  Top Layer w0.26: v1(23.39,12.15) 23.4,12.16 U1.17 ; v1(20.2,10.27) 18.76,8.84 U4.1
  Bottom Layer w0.26: v1(20.2,10.27) 21.13,10.27 23,12.15 v1(23.39,12.15)
SPI_MISO: length 32.4
  Top Layer w0.26: v1(30.44,16.53) 30.44,17.88 30.42,17.9 ; 16.37,7.57 17.27,7.57 v1(17.9,6.94) ; 16.37,7.57 U4.2 ; 16.37,7.57 16.37,6 13.39,3.01 MK1.7
  Bottom Layer w0.26: v1(17.9,6.94) 21.08,6.94 22.84,8.7 22.84,10.12 24.05,11.33 27.15,11.33 30.44,14.62 v1(30.44,16.53)
SPI_MOSI: length 52.2
  Top Layer w0.26: U4.5 v1(19.94,5.03) 17.45,5.03 14.05,1.62 10.18,1.62 9.66,2.15 9.66,4.28 MK1.6 ; 31.23,19.16 31.2,19.12 v1(31.2,18.95) ; 31.23,19.16 32.07,19.99 32.07,29.34 U8.4 ; 31.23,19.16 31.23,17.92 U1.4
  Bottom Layer w0.26: v1(19.94,5.03) 23.35,8.44 23.35,10.01 24.22,10.87 27.38,10.87 31.2,14.68 v1(31.2,18.95)
SPI_SCK: length 49.6
  Top Layer w0.26: 19.79,6.3 20.69,6.3 ; 19.79,6.3 19.58,6.51 v1(19.58,7.6) ; 19.79,6.3 17.79,6.3 v1(14.74,3.25) ; 20.69,6.3 20.74,6.26 21.35,6.26 ; 20.69,6.3 U4.6 21.35,6.26 ; 21.35,6.26 21.37,6.24 21.81,6.24 21.79,6.26 21.35,6.26 ; 28.82,19.43 28.82,19.42 ; 28.82,19.43 v1(28.77,19.47) 28.76,19.49 28.76,29.77 27.76,30.77 27.76,31.11 27.74,31.13 ; 28.82,19.43 U1.7
  Bottom Layer w0.26: v1(19.58,7.6) 19.69,7.6 23.84,11.75 26.87,11.75 28.77,13.66 v1(28.77,19.47) ; MK1.5 9.68,1.71 13.21,1.71 14.74,3.24 v1(14.74,3.25)
USB_VBUS: length 89.4
  Top Layer w0.3: 46.31,8.88 46.26,8.93 43.28,8.93 42.95,9.27 42.95,11.51 38.72,11.51 U7.4
  Top Layer w0.5: 12.11,10.95 11.18,10.95 10.39,11.73 10.39,13.74 C1.2 8.71,15.43 5.02,15.43 4.9,15.55 4.9,18.06 5.3,18.47 7.79,18.47 v1(7.8,18.46)
  Bottom Layer w0.5: v1(7.8,18.46) 7.8,22.22 7.35,22.66 6.47,22.66 6.47,30.31 H3.1
  Bottom Layer w0.6: 7.8,18.47 7.93,18.6 18.47,18.6 19.4,17.67 19.4,12.68 19.73,12.35 20.95,12.35 25.38,16.78 25.38,20.18 26.51,21.31 33.56,21.31 34.95,19.91 34.95,12.73 35.62,12.07 v1(38.23,12.07)
$1N559: length 15.2
  Bottom Layer w0.26: v1(53.68,24.88) 53.6,24.96 40.39,24.96 39.83,25.52 BUZZER1.2
$1N584: length 4.6
  Top Layer w0.26: R14.1 R13.1 50.92,26.09 Q4.1
$1N669: length 5.6
  Top Layer w0.26: LED13.2 20.6,1.54 22.61,3.55 24.86,3.55
$1N709: length 2.3
  Top Layer w0.3: LED14.1 35.95,5.17 37.96,5.17 38.13,4.99
$1N821: length 5.3
  Top Layer w0.26: 50.86,1.39 50.91,1.34
  Top Layer w0.3: R1.2 50.86,3.38 U5.6
  Bottom Layer w0.3: U5.6 U5.7
$1N17643: length 4.3
  Top Layer w0.26: LED1.2 26.25,1.64 28.4,1.64 28.79,2.03 28.79,2.81
$1N17699: length 3
  Top Layer w0.26: 29.59,2.81 29.59,2.22 30.75,1.06 LED2.2
$1N17755: length 8
  Top Layer w0.26: LED3.2 36.61,1.79 30.82,1.79 30.39,2.22 30.39,2.81
$1N17811: length 12.7
  Top Layer w0.26: 31.19,2.81 41.44,2.81 LED4.2
$1N51830: length 5.6
  Top Layer w0.3: 1.2 37.98,10.84 36.94,11.88 36.94,14 37.61,14.67 U7.2
$1N51836: length 3.5
  Top Layer w0.5: R22.1 48.33,9.34 LED5.1 LED5.3
$1N51837: length 3.5
  Top Layer w0.3: U7.7 44.67,14.67 45.58,13.76 45.58,13.48 45.93,13.14 LED5.4
$1N51838: length 6.4
  Top Layer w0.5: v1(47.13,13) 47.13,11.2 46.8,10.87 LED5.2
  Bottom Layer w0.5: v1(47.13,13) 46.74,13.39 v1(43.98,13.39)
$1N53808: length 31.4
  Top Layer w0.3: U11.3 55.8,29.14 53.03,29.14 53.03,28.8 52.09,27.85 46.74,27.85 45.53,26.64 45.53,17.37 U7.8 43.26,15.94 42.92,15.59 42.92,12.58 43.36,12.13 U7.5
  Top Layer w0.6: C9.2 44.1,10.41 U7.5
$1N54478: length 54.4
  Top Layer w0.3: v1(34.91,3.91) v1(34.91,5.05) 34.91,6.99 33.91,7.98 33.91,16.42 34.55,17.06 44.02,17.06 44.54,17.57 44.54,27.01 46.44,28.91 48.36,28.91 SW13.3 SW13.2
  Top Layer w0.6: U3.1 44.82,2.79 v1(44.8,2.78)
  Bottom Layer w0.6: v1(44.8,2.78) 42.42,2.78 38.59,6.61 U10.1 37.43,6.4 34.91,6.4 v1(34.91,5.05) v1(34.91,3.91)

## Copper pours and planes (outline as drawn; the poured copper is in the pictures)
GND on Top Layer: -0.1,33.39 60.04,33.39 60.04,-0.07 -0.1,-0.07
GND on Bottom Layer: 60.19,-0.01 0.04,-0.01 0.04,33.45 60.19,33.45

## Text on the board
Top Solder Mask Layer: 星 / 火 | 计 / 划
Top Silkscreen Layer: V G R T
